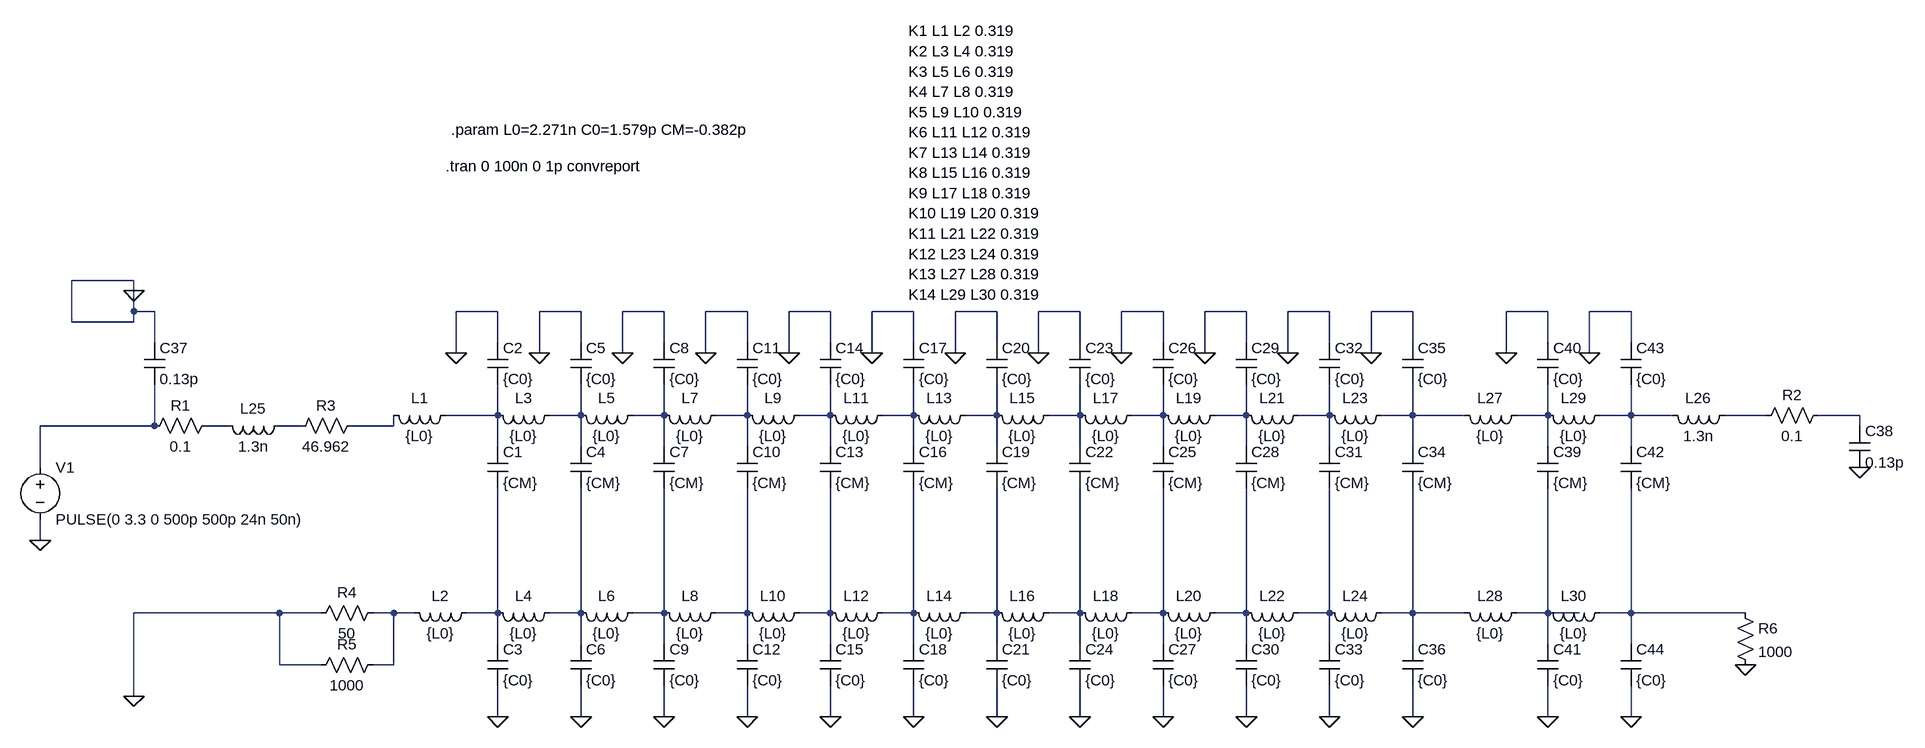
[diagram p0: schematic Assignment1_Broadside.asc]
Assignment1_Broadside.asc, the LTspice schematic file:
Version 4.1
SHEET 1 1676 772
WIRE -1056 80 -1152 80
WIRE -1056 96 -1056 80
WIRE -1056 128 -1056 96
WIRE -1024 128 -1056 128
WIRE -496 128 -560 128
WIRE -368 128 -432 128
WIRE -240 128 -304 128
WIRE -112 128 -176 128
WIRE 16 128 -48 128
WIRE 144 128 80 128
WIRE 272 128 208 128
WIRE 400 128 336 128
WIRE 528 128 464 128
WIRE 656 128 592 128
WIRE 784 128 720 128
WIRE 912 128 848 128
WIRE 1120 128 1056 128
WIRE 1248 128 1184 128
WIRE -1152 144 -1152 80
WIRE -1056 144 -1056 128
WIRE -1056 144 -1152 144
WIRE -1024 176 -1024 128
WIRE -496 176 -496 128
WIRE -368 176 -368 128
WIRE -240 176 -240 128
WIRE -112 176 -112 128
WIRE 16 176 16 128
WIRE 144 176 144 128
WIRE 272 176 272 128
WIRE 400 176 400 128
WIRE 528 176 528 128
WIRE 656 176 656 128
WIRE 784 176 784 128
WIRE 912 176 912 128
WIRE 1120 176 1120 128
WIRE 1248 176 1248 128
WIRE -560 192 -560 128
WIRE -432 192 -432 128
WIRE -304 192 -304 128
WIRE -176 192 -176 128
WIRE -48 192 -48 128
WIRE 80 192 80 128
WIRE 208 192 208 128
WIRE 336 192 336 128
WIRE 464 192 464 128
WIRE 592 192 592 128
WIRE 720 192 720 128
WIRE 848 192 848 128
WIRE 1056 192 1056 128
WIRE 1184 192 1184 128
WIRE -496 288 -496 240
WIRE -496 288 -576 288
WIRE -368 288 -368 240
WIRE -368 288 -416 288
WIRE -240 288 -240 240
WIRE -240 288 -288 288
WIRE -112 288 -112 240
WIRE -112 288 -160 288
WIRE 16 288 16 240
WIRE 16 288 -32 288
WIRE 144 288 144 240
WIRE 144 288 96 288
WIRE 272 288 272 240
WIRE 272 288 224 288
WIRE 400 288 400 240
WIRE 400 288 352 288
WIRE 528 288 528 240
WIRE 528 288 480 288
WIRE 656 288 656 240
WIRE 656 288 608 288
WIRE 784 288 784 240
WIRE 784 288 736 288
WIRE 912 288 912 240
WIRE 912 288 864 288
WIRE 992 288 912 288
WIRE 1120 288 1120 240
WIRE 1120 288 1072 288
WIRE 1248 288 1248 240
WIRE 1248 288 1200 288
WIRE 1312 288 1248 288
WIRE 1456 288 1392 288
WIRE 1600 288 1536 288
WIRE -1024 304 -1024 240
WIRE -1024 304 -1200 304
WIRE -912 304 -944 304
WIRE -800 304 -832 304
WIRE -656 304 -656 288
WIRE -656 304 -720 304
WIRE 1600 304 1600 288
WIRE -496 336 -496 288
WIRE -368 336 -368 288
WIRE -240 336 -240 288
WIRE -112 336 -112 288
WIRE 16 336 16 288
WIRE 144 336 144 288
WIRE 272 336 272 288
WIRE 400 336 400 288
WIRE 528 336 528 288
WIRE 656 336 656 288
WIRE 784 336 784 288
WIRE 912 336 912 288
WIRE 1120 336 1120 288
WIRE 1248 336 1248 288
WIRE -1200 368 -1200 304
WIRE -1200 480 -1200 448
WIRE -832 592 -1056 592
WIRE -768 592 -832 592
WIRE -656 592 -688 592
WIRE -624 592 -656 592
WIRE -496 592 -496 400
WIRE -496 592 -544 592
WIRE -368 592 -368 400
WIRE -368 592 -416 592
WIRE -240 592 -240 400
WIRE -240 592 -288 592
WIRE -112 592 -112 400
WIRE -112 592 -160 592
WIRE 16 592 16 400
WIRE 16 592 -32 592
WIRE 144 592 144 400
WIRE 144 592 96 592
WIRE 272 592 272 400
WIRE 272 592 224 592
WIRE 400 592 400 400
WIRE 400 592 352 592
WIRE 528 592 528 400
WIRE 528 592 480 592
WIRE 656 592 656 400
WIRE 656 592 608 592
WIRE 784 592 784 400
WIRE 784 592 736 592
WIRE 912 592 912 400
WIRE 912 592 864 592
WIRE 992 592 912 592
WIRE 1120 592 1120 400
WIRE 1120 592 1072 592
WIRE 1168 592 1120 592
WIRE 1248 592 1248 400
WIRE 1248 592 1200 592
WIRE 1424 592 1248 592
WIRE -496 640 -496 592
WIRE -368 640 -368 592
WIRE -240 640 -240 592
WIRE -112 640 -112 592
WIRE 16 640 16 592
WIRE 144 640 144 592
WIRE 272 640 272 592
WIRE 400 640 400 592
WIRE 528 640 528 592
WIRE 656 640 656 592
WIRE 784 640 784 592
WIRE 912 640 912 592
WIRE 1120 640 1120 592
WIRE 1248 640 1248 592
WIRE -832 672 -832 592
WIRE -768 672 -832 672
WIRE -656 672 -656 592
WIRE -656 672 -688 672
WIRE -1056 720 -1056 592
WIRE -496 752 -496 704
WIRE -368 752 -368 704
WIRE -240 752 -240 704
WIRE -112 752 -112 704
WIRE 16 752 16 704
WIRE 144 752 144 704
WIRE 272 752 272 704
WIRE 400 752 400 704
WIRE 528 752 528 704
WIRE 656 752 656 704
WIRE 784 752 784 704
WIRE 912 752 912 704
WIRE 1120 752 1120 704
WIRE 1248 752 1248 704
FLAG -1200 480 0
FLAG -560 192 0
FLAG -496 752 0
FLAG -432 192 0
FLAG -368 752 0
FLAG -304 192 0
FLAG -240 752 0
FLAG -176 192 0
FLAG -112 752 0
FLAG -48 192 0
FLAG 16 752 0
FLAG 80 192 0
FLAG 144 752 0
FLAG 208 192 0
FLAG 272 752 0
FLAG 336 192 0
FLAG 400 752 0
FLAG 464 192 0
FLAG 528 752 0
FLAG 592 192 0
FLAG 656 752 0
FLAG 720 192 0
FLAG 784 752 0
FLAG 848 192 0
FLAG 912 752 0
FLAG -1056 96 0
FLAG 1600 368 0
FLAG -1056 720 0
FLAG 1424 672 0
FLAG 1056 192 0
FLAG 1120 752 0
FLAG 1184 192 0
FLAG 1248 752 0
SYMBOL voltage -1200 352 R0
WINDOW 123 0 0 Left 0
WINDOW 39 0 0 Left 0
SYMATTR InstName V1
SYMATTR Value PULSE(0 3.3 0 500p 500p 24n 50n)
SYMBOL res -928 288 R90
WINDOW 0 0 56 VBottom 2
WINDOW 3 32 56 VTop 2
SYMATTR InstName R1
SYMATTR Value 0.1
SYMBOL ind -560 272 R90
WINDOW 0 5 56 VBottom 2
WINDOW 3 32 56 VTop 2
SYMATTR InstName L1
SYMATTR Value {L0}
SYMATTR Type ind
SYMATTR SpiceLine Rser=1m
SYMBOL cap -512 336 R0
SYMATTR InstName C1
SYMATTR Value {CM}
SYMBOL cap -512 176 R0
SYMATTR InstName C2
SYMATTR Value {C0}
SYMBOL ind -528 576 R90
WINDOW 0 5 56 VBottom 2
WINDOW 3 32 56 VTop 2
SYMATTR InstName L2
SYMATTR Value {L0}
SYMATTR Type ind
SYMATTR SpiceLine Rser=1m
SYMBOL cap -512 640 R0
SYMATTR InstName C3
SYMATTR Value {C0}
SYMBOL ind -400 272 R90
WINDOW 0 5 56 VBottom 2
WINDOW 3 32 56 VTop 2
SYMATTR InstName L3
SYMATTR Value {L0}
SYMATTR Type ind
SYMATTR SpiceLine Rser=1m
SYMBOL cap -384 336 R0
SYMATTR InstName C4
SYMATTR Value {CM}
SYMBOL cap -384 176 R0
SYMATTR InstName C5
SYMATTR Value {C0}
SYMBOL ind -400 576 R90
WINDOW 0 5 56 VBottom 2
WINDOW 3 32 56 VTop 2
SYMATTR InstName L4
SYMATTR Value {L0}
SYMATTR Type ind
SYMATTR SpiceLine Rser=1m
SYMBOL cap -384 640 R0
SYMATTR InstName C6
SYMATTR Value {C0}
SYMBOL ind -272 272 R90
WINDOW 0 5 56 VBottom 2
WINDOW 3 32 56 VTop 2
SYMATTR InstName L5
SYMATTR Value {L0}
SYMATTR Type ind
SYMATTR SpiceLine Rser=1m
SYMBOL cap -256 336 R0
SYMATTR InstName C7
SYMATTR Value {CM}
SYMBOL cap -256 176 R0
SYMATTR InstName C8
SYMATTR Value {C0}
SYMBOL ind -272 576 R90
WINDOW 0 5 56 VBottom 2
WINDOW 3 32 56 VTop 2
SYMATTR InstName L6
SYMATTR Value {L0}
SYMATTR Type ind
SYMATTR SpiceLine Rser=1m
SYMBOL cap -256 640 R0
SYMATTR InstName C9
SYMATTR Value {C0}
SYMBOL ind -144 272 R90
WINDOW 0 5 56 VBottom 2
WINDOW 3 32 56 VTop 2
SYMATTR InstName L7
SYMATTR Value {L0}
SYMATTR Type ind
SYMATTR SpiceLine Rser=1m
SYMBOL cap -128 336 R0
SYMATTR InstName C10
SYMATTR Value {CM}
SYMBOL cap -128 176 R0
SYMATTR InstName C11
SYMATTR Value {C0}
SYMBOL ind -144 576 R90
WINDOW 0 5 56 VBottom 2
WINDOW 3 32 56 VTop 2
SYMATTR InstName L8
SYMATTR Value {L0}
SYMATTR Type ind
SYMATTR SpiceLine Rser=1m
SYMBOL cap -128 640 R0
SYMATTR InstName C12
SYMATTR Value {C0}
SYMBOL ind -16 272 R90
WINDOW 0 5 56 VBottom 2
WINDOW 3 32 56 VTop 2
SYMATTR InstName L9
SYMATTR Value {L0}
SYMATTR Type ind
SYMATTR SpiceLine Rser=1m
SYMBOL cap 0 336 R0
SYMATTR InstName C13
SYMATTR Value {CM}
SYMBOL cap 0 176 R0
SYMATTR InstName C14
SYMATTR Value {C0}
SYMBOL ind -16 576 R90
WINDOW 0 5 56 VBottom 2
WINDOW 3 32 56 VTop 2
SYMATTR InstName L10
SYMATTR Value {L0}
SYMATTR Type ind
SYMATTR SpiceLine Rser=1m
SYMBOL cap 0 640 R0
SYMATTR InstName C15
SYMATTR Value {C0}
SYMBOL ind 112 272 R90
WINDOW 0 5 56 VBottom 2
WINDOW 3 32 56 VTop 2
SYMATTR InstName L11
SYMATTR Value {L0}
SYMATTR Type ind
SYMATTR SpiceLine Rser=1m
SYMBOL cap 128 336 R0
SYMATTR InstName C16
SYMATTR Value {CM}
SYMBOL cap 128 176 R0
SYMATTR InstName C17
SYMATTR Value {C0}
SYMBOL ind 112 576 R90
WINDOW 0 5 56 VBottom 2
WINDOW 3 32 56 VTop 2
SYMATTR InstName L12
SYMATTR Value {L0}
SYMATTR Type ind
SYMATTR SpiceLine Rser=1m
SYMBOL cap 128 640 R0
SYMATTR InstName C18
SYMATTR Value {C0}
SYMBOL ind 240 272 R90
WINDOW 0 5 56 VBottom 2
WINDOW 3 32 56 VTop 2
SYMATTR InstName L13
SYMATTR Value {L0}
SYMATTR Type ind
SYMATTR SpiceLine Rser=1m
SYMBOL cap 256 336 R0
SYMATTR InstName C19
SYMATTR Value {CM}
SYMBOL cap 256 176 R0
SYMATTR InstName C20
SYMATTR Value {C0}
SYMBOL ind 240 576 R90
WINDOW 0 5 56 VBottom 2
WINDOW 3 32 56 VTop 2
SYMATTR InstName L14
SYMATTR Value {L0}
SYMATTR Type ind
SYMATTR SpiceLine Rser=1m
SYMBOL cap 256 640 R0
SYMATTR InstName C21
SYMATTR Value {C0}
SYMBOL ind 368 272 R90
WINDOW 0 5 56 VBottom 2
WINDOW 3 32 56 VTop 2
SYMATTR InstName L15
SYMATTR Value {L0}
SYMATTR Type ind
SYMATTR SpiceLine Rser=1m
SYMBOL cap 384 336 R0
SYMATTR InstName C22
SYMATTR Value {CM}
SYMBOL cap 384 176 R0
SYMATTR InstName C23
SYMATTR Value {C0}
SYMBOL ind 368 576 R90
WINDOW 0 5 56 VBottom 2
WINDOW 3 32 56 VTop 2
SYMATTR InstName L16
SYMATTR Value {L0}
SYMATTR Type ind
SYMATTR SpiceLine Rser=1m
SYMBOL cap 384 640 R0
SYMATTR InstName C24
SYMATTR Value {C0}
SYMBOL ind 496 272 R90
WINDOW 0 5 56 VBottom 2
WINDOW 3 32 56 VTop 2
SYMATTR InstName L17
SYMATTR Value {L0}
SYMATTR Type ind
SYMATTR SpiceLine Rser=1m
SYMBOL cap 512 336 R0
SYMATTR InstName C25
SYMATTR Value {CM}
SYMBOL cap 512 176 R0
SYMATTR InstName C26
SYMATTR Value {C0}
SYMBOL ind 496 576 R90
WINDOW 0 5 56 VBottom 2
WINDOW 3 32 56 VTop 2
SYMATTR InstName L18
SYMATTR Value {L0}
SYMATTR Type ind
SYMATTR SpiceLine Rser=1m
SYMBOL cap 512 640 R0
SYMATTR InstName C27
SYMATTR Value {C0}
SYMBOL ind 624 272 R90
WINDOW 0 5 56 VBottom 2
WINDOW 3 32 56 VTop 2
SYMATTR InstName L19
SYMATTR Value {L0}
SYMATTR Type ind
SYMATTR SpiceLine Rser=1m
SYMBOL cap 640 336 R0
SYMATTR InstName C28
SYMATTR Value {CM}
SYMBOL cap 640 176 R0
SYMATTR InstName C29
SYMATTR Value {C0}
SYMBOL ind 624 576 R90
WINDOW 0 5 56 VBottom 2
WINDOW 3 32 56 VTop 2
SYMATTR InstName L20
SYMATTR Value {L0}
SYMATTR Type ind
SYMATTR SpiceLine Rser=1m
SYMBOL cap 640 640 R0
SYMATTR InstName C30
SYMATTR Value {C0}
SYMBOL ind 752 272 R90
WINDOW 0 5 56 VBottom 2
WINDOW 3 32 56 VTop 2
SYMATTR InstName L21
SYMATTR Value {L0}
SYMATTR Type ind
SYMATTR SpiceLine Rser=1m
SYMBOL cap 768 336 R0
SYMATTR InstName C31
SYMATTR Value {CM}
SYMBOL cap 768 176 R0
SYMATTR InstName C32
SYMATTR Value {C0}
SYMBOL ind 752 576 R90
WINDOW 0 5 56 VBottom 2
WINDOW 3 32 56 VTop 2
SYMATTR InstName L22
SYMATTR Value {L0}
SYMATTR Type ind
SYMATTR SpiceLine Rser=1m
SYMBOL cap 768 640 R0
SYMATTR InstName C33
SYMATTR Value {C0}
SYMBOL ind 880 272 R90
WINDOW 0 5 56 VBottom 2
WINDOW 3 32 56 VTop 2
SYMATTR InstName L23
SYMATTR Value {L0}
SYMATTR Type ind
SYMATTR SpiceLine Rser=1m
SYMBOL cap 896 336 R0
SYMATTR InstName C34
SYMATTR Value {CM}
SYMBOL cap 896 176 R0
SYMATTR InstName C35
SYMATTR Value {C0}
SYMBOL ind 880 576 R90
WINDOW 0 5 56 VBottom 2
WINDOW 3 32 56 VTop 2
SYMATTR InstName L24
SYMATTR Value {L0}
SYMATTR Type ind
SYMATTR SpiceLine Rser=1m
SYMBOL cap 896 640 R0
SYMATTR InstName C36
SYMATTR Value {C0}
SYMBOL ind -816 288 R90
WINDOW 0 5 56 VBottom 2
WINDOW 3 32 56 VTop 2
SYMATTR InstName L25
SYMATTR Value 1.3n
SYMATTR SpiceLine Rser=0
SYMBOL cap -1040 176 R0
SYMATTR InstName C37
SYMATTR Value 0.13p
SYMBOL ind 1408 272 R90
WINDOW 0 5 56 VBottom 2
WINDOW 3 32 56 VTop 2
SYMATTR InstName L26
SYMATTR Value 1.3n
SYMATTR SpiceLine Rser=0
SYMBOL res 1552 272 R90
WINDOW 0 0 56 VBottom 2
WINDOW 3 32 56 VTop 2
SYMATTR InstName R2
SYMATTR Value 0.1
SYMBOL cap 1584 304 R0
SYMATTR InstName C38
SYMATTR Value 0.13p
SYMBOL res -704 288 R90
WINDOW 0 0 56 VBottom 2
WINDOW 3 32 56 VTop 2
SYMATTR InstName R3
SYMATTR Value 46.962
SYMBOL res -672 576 R90
WINDOW 0 0 56 VBottom 2
WINDOW 3 32 56 VTop 2
SYMATTR InstName R4
SYMATTR Value 50
SYMBOL res -672 656 R90
WINDOW 0 0 56 VBottom 2
WINDOW 3 32 56 VTop 2
SYMATTR InstName R5
SYMATTR Value 1000
SYMBOL res 1408 576 R0
SYMATTR InstName R6
SYMATTR Value 1000
SYMBOL ind 1088 272 R90
WINDOW 0 5 56 VBottom 2
WINDOW 3 32 56 VTop 2
SYMATTR InstName L27
SYMATTR Value {L0}
SYMATTR Type ind
SYMATTR SpiceLine Rser=1m
SYMBOL cap 1104 336 R0
SYMATTR InstName C39
SYMATTR Value {CM}
SYMBOL cap 1104 176 R0
SYMATTR InstName C40
SYMATTR Value {C0}
SYMBOL ind 1088 576 R90
WINDOW 0 5 56 VBottom 2
WINDOW 3 32 56 VTop 2
SYMATTR InstName L28
SYMATTR Value {L0}
SYMATTR Type ind
SYMATTR SpiceLine Rser=1m
SYMBOL cap 1104 640 R0
SYMATTR InstName C41
SYMATTR Value {C0}
SYMBOL ind 1216 272 R90
WINDOW 0 5 56 VBottom 2
WINDOW 3 32 56 VTop 2
SYMATTR InstName L29
SYMATTR Value {L0}
SYMATTR Type ind
SYMATTR SpiceLine Rser=1m
SYMBOL cap 1232 336 R0
SYMATTR InstName C42
SYMATTR Value {CM}
SYMBOL cap 1232 176 R0
SYMATTR InstName C43
SYMATTR Value {C0}
SYMBOL ind 1216 576 R90
WINDOW 0 5 56 VBottom 2
WINDOW 3 32 56 VTop 2
SYMATTR InstName L30
SYMATTR Value {L0}
SYMATTR Type ind
SYMATTR SpiceLine Rser=1m
SYMBOL cap 1232 640 R0
SYMATTR InstName C44
SYMATTR Value {C0}
TEXT -568 -152 Left 2 !.param L0=2.271n C0=1.579p CM=-0.382p
TEXT -576 -96 Left 2 !.tran 0 100n 0 1p convreport
TEXT 136 -304 Left 2 !K1 L1 L2 0.319\nK2 L3 L4 0.319\nK3 L5 L6 0.319\nK4 L7 L8 0.319\nK5 L9 L10 0.319\nK6 L11 L12 0.319\nK7 L13 L14 0.319\nK8 L15 L16 0.319\nK9 L17 L18 0.319\nK10 L19 L20 0.319\nK11 L21 L22 0.319\nK12 L23 L24 0.319\nK13 L27 L28 0.319\nK14 L29 L30 0.319

The netlist it stands for:
* Assignment1_Broadside.asc
V1 N017 0 PULSE(0 3.3 0 500p 500p 24n 50n)
R1 N018 N017 0.1
L1 N001 N020 {L0} Rser=1m
C1 N001 N022 {CM}
C2 0 N001 {C0}
L2 N022 N021 {L0} Rser=1m
C3 N022 0 {C0}
L3 N002 N001 {L0} Rser=1m
C4 N002 N023 {CM}
C5 0 N002 {C0}
L4 N023 N022 {L0} Rser=1m
C6 N023 0 {C0}
L5 N003 N002 {L0} Rser=1m
C7 N003 N024 {CM}
C8 0 N003 {C0}
L6 N024 N023 {L0} Rser=1m
C9 N024 0 {C0}
L7 N004 N003 {L0} Rser=1m
C10 N004 N025 {CM}
C11 0 N004 {C0}
L8 N025 N024 {L0} Rser=1m
C12 N025 0 {C0}
L9 N005 N004 {L0} Rser=1m
C13 N005 N026 {CM}
C14 0 N005 {C0}
L10 N026 N025 {L0} Rser=1m
C15 N026 0 {C0}
L11 N006 N005 {L0} Rser=1m
C16 N006 N027 {CM}
C17 0 N006 {C0}
L12 N027 N026 {L0} Rser=1m
C18 N027 0 {C0}
L13 N007 N006 {L0} Rser=1m
C19 N007 N028 {CM}
C20 0 N007 {C0}
L14 N028 N027 {L0} Rser=1m
C21 N028 0 {C0}
L15 N008 N007 {L0} Rser=1m
C22 N008 N029 {CM}
C23 0 N008 {C0}
L16 N029 N028 {L0} Rser=1m
C24 N029 0 {C0}
L17 N009 N008 {L0} Rser=1m
C25 N009 N030 {CM}
C26 0 N009 {C0}
L18 N030 N029 {L0} Rser=1m
C27 N030 0 {C0}
L19 N010 N009 {L0} Rser=1m
C28 N010 N031 {CM}
C29 0 N010 {C0}
L20 N031 N030 {L0} Rser=1m
C30 N031 0 {C0}
L21 N011 N010 {L0} Rser=1m
C31 N011 N032 {CM}
C32 0 N011 {C0}
L22 N032 N031 {L0} Rser=1m
C33 N032 0 {C0}
L23 N012 N011 {L0} Rser=1m
C34 N012 N033 {CM}
C35 0 N012 {C0}
L24 N033 N032 {L0} Rser=1m
C36 N033 0 {C0}
L25 N019 N018 1.3n Rser=0
C37 0 N017 0.13p
L26 N015 N014 1.3n Rser=0
R2 N016 N015 0.1
C38 N016 0 0.13p
R3 N020 N019 46.962
R4 N021 0 50
R5 N021 0 1000
R6 N035 0 1000
L27 N013 N012 {L0} Rser=1m
C39 N013 N034 {CM}
C40 0 N013 {C0}
L28 N034 N033 {L0} Rser=1m
C41 N034 0 {C0}
L29 N014 N013 {L0} Rser=1m
C42 N014 N035 {CM}
C43 0 N014 {C0}
L30 N035 N034 {L0} Rser=1m
C44 N035 0 {C0}
.param L0=2.271n C0=1.579p CM=-0.382p
.tran 0 100n 0 1p convreport
K1 L1 L2 0.319
K2 L3 L4 0.319
K3 L5 L6 0.319
K4 L7 L8 0.319
K5 L9 L10 0.319
K6 L11 L12 0.319
K7 L13 L14 0.319
K8 L15 L16 0.319
K9 L17 L18 0.319
K10 L19 L20 0.319
K11 L21 L22 0.319
K12 L23 L24 0.319
K13 L27 L28 0.319
K14 L29 L30 0.319
.backanno
.end